# Altium schematic sheet RK3568-SARADC-GPIO.SchDoc
size 420 x 297 mm; SheetNumber: 9; SheetTotal: 25
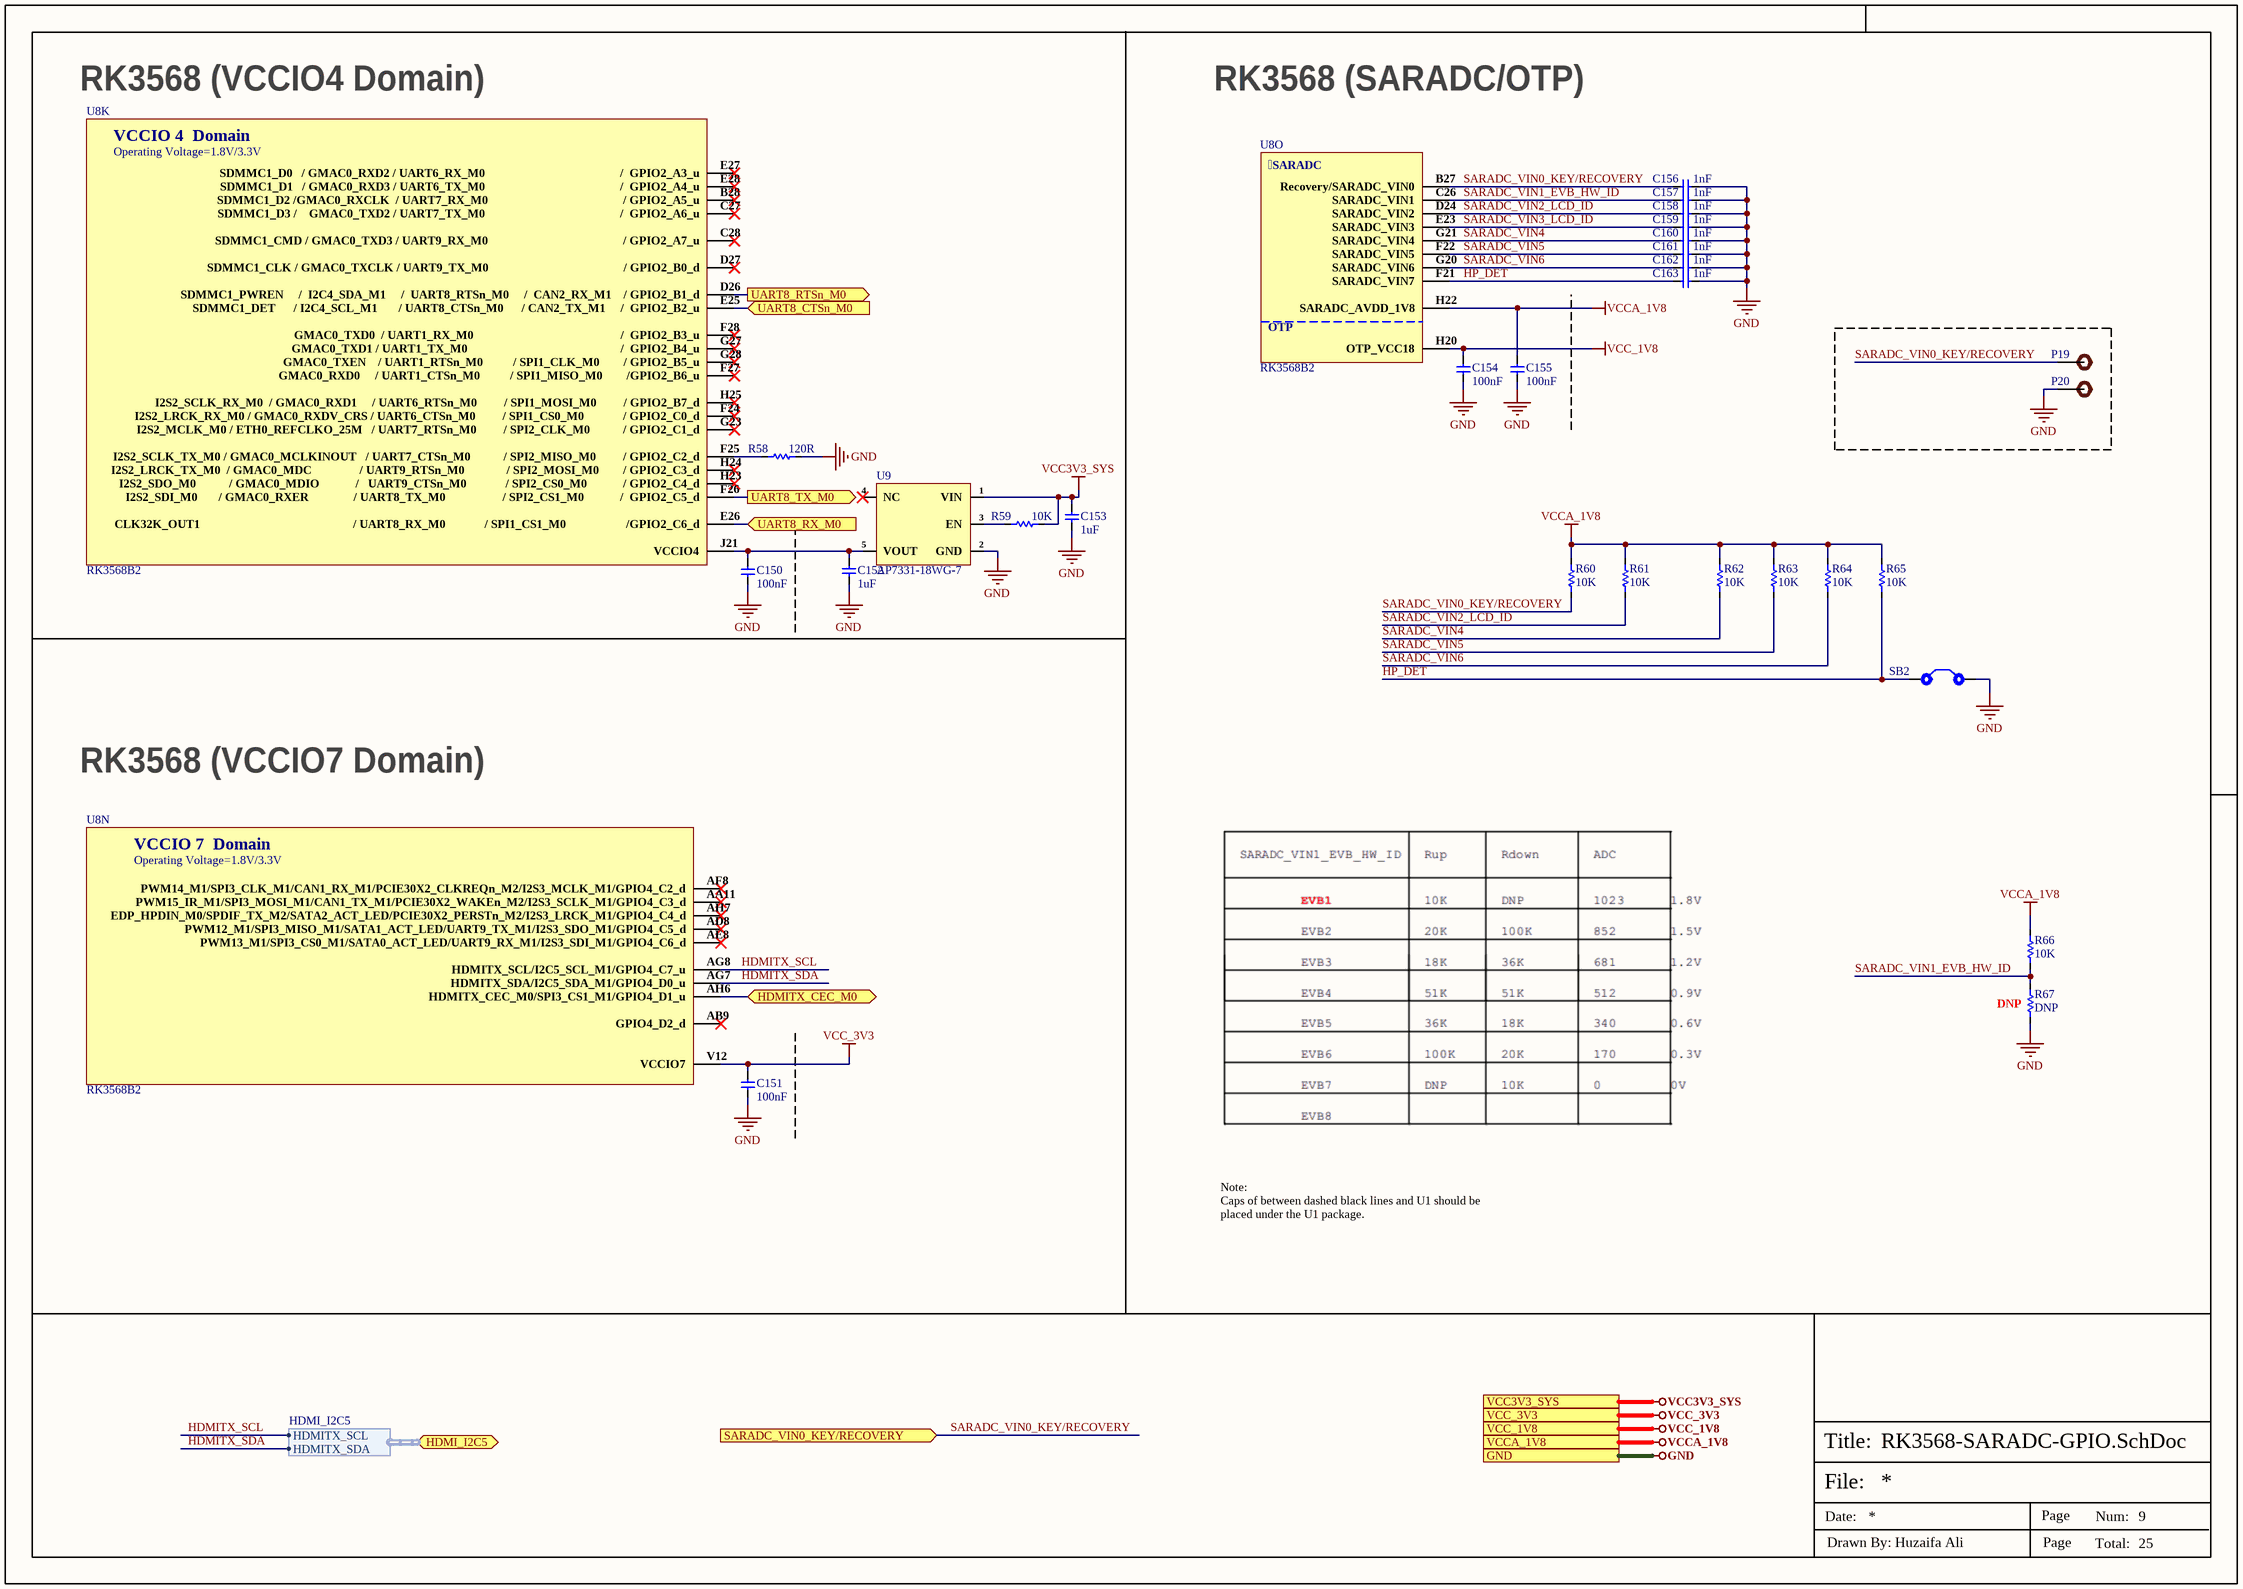
[diagram p0: RK3568-SARADC-GPIO.SchDoc]

## Parts
C150  100nF  [CAP-0201]
C151  100nF  [CAP-0201]
C152  1uF  [Cap-0402]
C153  1uF  [Cap-0402]
C154  100nF  [CAP-0201]
C155  100nF  [CAP-0201]
C156  1nF  [CAP-0201]
C157  1nF  [CAP-0201]
C158  1nF  [CAP-0201]
C159  1nF  [CAP-0201]
C160  1nF  [CAP-0201]
C161  1nF  [CAP-0201]
C162  1nF  [CAP-0201]
C163  1nF  [CAP-0201]
P19  TEST POINT 0.5mm Dia  [Test-point - 0.5mm]  (value not drawn)  (no BOM)
P20  TEST POINT 0.5mm Dia  [Test-point - 0.5mm]  (value not drawn)  (no BOM)
R58  120R  [Res-0201]
R59  10K  [Res-0402]
R60  10K  [Res-0201]
R61  10K  [Res-0201]
R62  10K  [Res-0201]
R63  10K  [Res-0201]
R64  10K  [Res-0201]
R65  10K  [Res-0201]
R66  10K  [Res-0201]
R67  DNP  [Res-0201]
SB2  Solder Bridge 0402  [Solder Bridge 0402]  (value not drawn)  (no BOM)
U8  RK3568B2  [FCCSP-636L]  (parts K,N,O of 23)
U9  AP7331-18WG-7  [SOT-23-5]

## Ports
GND (see CAN-Bus-SPI-Flash-Sheet[4D], Connector-Sheet[5D], DRAM-LPDDR4x-Sheet[4D], eMMC-Sheet[4D], LED-Debug-Sheet[4D], Power-DC-IN-Sheet[4D], Power-Others-Sheet[4D], Power-PMIC-Sheet[4D], RK3568-Audio-Interface[4D], RK3568-Flash-SD-Controller[4D], RK3568-OSC-PMUIO-Sheet[5D], RK3568-Power-Sheet[4D], RK3568-USB-PCIe-Sheet[5D], RK3568-VI-Interface-Sheet[4D], RK3568-VO-Interface-1[4D], RK3568-VO-Interface-2[4D], Sensors-Sheet-1[4D], Sensors-Sheet-2[5D], Type-C-Sheet[4D], USB-Ports[4D], VO-HDMI2.0-TX-Sheet[4D], VO-LCM-MIPI-DSI-TX0[4D], WIFI-BT-SDIO-Sheet[4D]), HDMI_I2C5 (bidir, harness HDMI_I2C5, see VO-HDMI2.0-TX-Sheet[4D]), HDMITX_CEC_M0 (bidir, see VO-HDMI2.0-TX-Sheet[1C]), SARADC_VIN0_KEY/RECOVERY (in, see LED-Debug-Sheet[4A]), UART8_CTSn_M0 (in, see WIFI-BT-SDIO-Sheet[4B]), UART8_RTSn_M0 (out, see WIFI-BT-SDIO-Sheet[4B]), UART8_RX_M0 (in, see WIFI-BT-SDIO-Sheet[4B]), UART8_TX_M0 (out, see WIFI-BT-SDIO-Sheet[4B]), VCC3V3_SYS (see DRAM-LPDDR4x-Sheet[4D], Power-DC-IN-Sheet[4D], Power-PMIC-Sheet[3D]), VCC_1V8 (see Power-Others-Sheet[4D], Power-PMIC-Sheet[4D], RK3568-VI-Interface-Sheet[4D], WIFI-BT-SDIO-Sheet[4D]), VCC_3V3 (see eMMC-Sheet[4D], Power-PMIC-Sheet[4D], RK3568-USB-PCIe-Sheet[5D], RK3568-VO-Interface-2[4D], VO-HDMI2.0-TX-Sheet[4D], WIFI-BT-SDIO-Sheet[4D]), VCCA_1V8 (see LED-Debug-Sheet[4D], Power-PMIC-Sheet[4D], RK3568-OSC-PMUIO-Sheet[5D], RK3568-USB-PCIe-Sheet[5D])

## Harnesses
HDMI_I2C5: HDMITX_SCL, HDMITX_SDA

## Nets
GND: C150.1 C151.1 C152.2 C153.2 C154.1 C155.1 C156.2 C157.2 C158.2 C159.2 C160.2 C161.2 C162.2 C163.2 P20.1 R58.2 R67.2 SB2.2 U9.2(GND) ; port GND
VCC3V3_SYS: C153.1 R59.1 U9.1(VIN) ; port VCC3V3_SYS
VCC_1V8: C154.2 U8.H20(OTP_VCC18) ; port VCC_1V8
VCC_3V3: C151.2 U8.V12(VCCIO7) ; port VCC_3V3
VCCA_1V8: C155.2 R60.1 R61.1 R62.1 R63.1 R64.1 R65.1 R66.1 U8.H22(SARADC_AVDD_1V8) ; port VCCA_1V8
HDMITX_CEC_M0: U8.AH6(HDMITX_CEC_M0/SPI3_CS1_M1/GPIO4_D1_u) ; port HDMITX_CEC_M0
HDMITX_SCL: U8.AG8(HDMITX_SCL/I2C5_SCL_M1/GPIO4_C7_u) ; port HDMI_I2C5.HDMITX_SCL
HDMITX_SDA: U8.AG7(HDMITX_SDA/I2C5_SDA_M1/GPIO4_D0_u) ; port HDMI_I2C5.HDMITX_SDA
HP_DET: C163.1 R65.2 SB2.1 U8.F21(SARADC_VIN7)
SARADC_VIN0_KEY/RECOVERY: C156.1 P19.1 R60.2 U8.B27(Recovery/SARADC_VIN0) ; port SARADC_VIN0_KEY/RECOVERY
SARADC_VIN1_EVB_HW_ID: C157.1 R66.2 R67.1 U8.C26(SARADC_VIN1)
SARADC_VIN2_LCD_ID: C158.1 R61.2 U8.D24(SARADC_VIN2)
SARADC_VIN3_LCD_ID: C159.1 U8.E23(SARADC_VIN3)
SARADC_VIN4: C160.1 R62.2 U8.G21(SARADC_VIN4)
SARADC_VIN5: C161.1 R63.2 U8.F22(SARADC_VIN5)
SARADC_VIN6: C162.1 R64.2 U8.G20(SARADC_VIN6)
UART8_CTSn_M0: U8.E25(SDMMC1_DET______/_I2C4_SCL_M1_______/_UART8_CTSn_M0______/_CAN2_TX_M1_____/__GPIO2_B2_u) ; port UART8_CTSn_M0
UART8_RTSn_M0: U8.D26(SDMMC1_PWREN_____/__I2C4_SDA_M1_____/__UART8_RTSn_M0_____/__CAN2_RX_M1____/_GPIO2_B1_d) ; port UART8_RTSn_M0
UART8_RX_M0: U8.E26(CLK32K_OUT1___________________________________________________/_UART8_RX_M0_____________/_SPI1_CS1_M0____________________/GPIO2_C6_d) ; port UART8_RX_M0
UART8_TX_M0: U8.F26(I2S2_SDI_M0_______/_GMAC0_RXER_______________/_UART8_TX_M0___________________/_SPI2_CS1_M0____________/__GPIO2_C5_d) ; port UART8_TX_M0
NetC150_2: C150.2 C152.1 U8.J21(VCCIO4) U9.5(VOUT)
NetR58_1: R58.1 U8.F25(I2S2_SCLK_TX_M0_/_GMAC0_MCLKINOUT___/_UART7_CTSn_M0___________/_SPI2_MISO_M0_________/_GPIO2_C2_d)
NetR59_2: R59.2 U9.3(EN)

Not connected (* = marked no-connect by the designer): U8 AA11(PWM15_IR_M1/SPI3_MOSI_M1/CAN1_TX_M1/PCIE30X2_WAKEn_M2/I2S3_SCLK_M1/GPIO4_C3_d)* AB9(GPIO4_D2_d)* AD8(PWM12_M1/SPI3_MISO_M1/SATA1_ACT_LED/UART9_TX_M1/I2S3_SDO_M1/GPIO4_C5_d)* AE8(PWM13_M1/SPI3_CS0_M1/SATA0_ACT_LED/UART9_RX_M1/I2S3_SDI_M1/GPIO4_C6_d)* AF8(PWM14_M1/SPI3_CLK_M1/CAN1_RX_M1/PCIE30X2_CLKREQn_M2/I2S3_MCLK_M1/GPIO4_C2_d)* AH7(EDP_HPDIN_M0/SPDIF_TX_M2/SATA2_ACT_LED/PCIE30X2_PERSTn_M2/I2S3_LRCK_M1/GPIO4_C4_d)* B28(SDMMC1_D2_/GMAC0_RXCLK__/_UART7_RX_M0_____________________________________________/_GPIO2_A5_u)* C27(SDMMC1_D3_/____GMAC0_TXD2_/_UART7_TX_M0_____________________________________________/__GPIO2_A6_u)* C28(SDMMC1_CMD_/_GMAC0_TXD3_/_UART9_RX_M0_____________________________________________/_GPIO2_A7_u)* D27(SDMMC1_CLK_/_GMAC0_TXCLK_/_UART9_TX_M0_____________________________________________/_GPIO2_B0_d)* E27(SDMMC1_D0___/_GMAC0_RXD2_/_UART6_RX_M0_____________________________________________/__GPIO2_A3_u)* E28(SDMMC1_D1___/_GMAC0_RXD3_/_UART6_TX_M0_____________________________________________/__GPIO2_A4_u)* F24(I2S2_LRCK_RX_M0_/_GMAC0_RXDV_CRS_/_UART6_CTSn_M0_________/_SPI1_CS0_M0_____________/_GPIO2_C0_d)* F27(GMAC0_RXD0_____/_UART1_CTSn_M0__________/_SPI1_MISO_M0________/GPIO2_B6_u)* F28(GMAC0_TXD0__/_UART1_RX_M0_________________________________________________/__GPIO2_B3_u)* G23(I2S2_MCLK_M0_/_ETH0_REFCLKO_25M___/_UART7_RTSn_M0_________/_SPI2_CLK_M0___________/_GPIO2_C1_d)* G27(GMAC0_TXD1_/_UART1_TX_M0___________________________________________________/__GPIO2_B4_u)* G28(GMAC0_TXEN____/_UART1_RTSn_M0__________/_SPI1_CLK_M0________/_GPIO2_B5_u)* H23(I2S2_SDO_M0___________/_GMAC0_MDIO____________/___UART9_CTSn_M0_____________/_SPI2_CS0_M0____________/_GPIO2_C4_d)* H24(I2S2_LRCK_TX_M0__/_GMAC0_MDC________________/_UART9_RTSn_M0______________/_SPI2_MOSI_M0________/_GPIO2_C3_d)* H25(I2S2_SCLK_RX_M0__/_GMAC0_RXD1_____/_UART6_RTSn_M0_________/_SPI1_MOSI_M0_________/_GPIO2_B7_d)*; U9 4(NC)*

## Notes on the sheet
- RK3568 (VCCIO4 Domain)
- RK3568 (SARADC/OTP)
- RK3568 (VCCIO7 Domain)
- (near R67) DNP
- Note:
  Caps of between dashed black lines and U1 should be placed under the U1 package.
- File:
- Title:
- Date:
- Page
- Num:
- Total:
- Drawn By: Huzaifa Ali
- (in symbol RK3568B2, part K) VCCIO 4  Domain; Operating Voltage=1.8V/3.3V
- (in symbol RK3568B2, part N) VCCIO 7  Domain; Operating Voltage=1.8V/3.3V
- (in symbol RK3568B2, part O) SARADC; OTP

## Library data of the parts
C150 C151 C154 C155 = CC0201KRX5R6BB104: CAP CER 0.1UF 10V X5R 0201; Manufacturer: Yageo; Tolerance: 10%; Supplier 1: Mouser; Manufacturer Part Number: CC0201KRX5R6BB104; RoHS: Yes; Category: Ceramic Capacitors; Stock 1: 824403; Pricing 1: 1=0.10000, 10=0.02400, 50=0.02400, 100=0.01900, 1000=0.01100, 10000=0.00900 (USD); Mount: Surface Mount; Case/Package: 0201; Case Code (Imperial): 0201; Case Code (Metric): 0603; Weight: 6E-06oz; Min Operating Temperature: -55°C; Max Operating Temperature: 85°C; Capacitance: 100nF; Dielectric: X5R; Voltage Rating (DC): 10V; Packaging: Tape and Reel; Termination: SMD/SMT; Resistor Type: Ceramic; Voltage Rating: 10V; Series: CC; Construction: Flat; Length: 0.6mm; Width: 0.012inch; Height: 0.3mm; Thickness: 0.013inch; Depth: 0.3mm; Radiation Hardening: No; Lead Free: Lead Free; Halogen Free: Halogen Free; RoHS Compliant: Yes; ComponentLink1URL: https://datasheet.ciiva.com/11587/upy-gphc-x5r-4v-to-50v-12-11587190.pdf?src-supplier=Avnet; ComponentLink1Description: https://datasheet.ciiva.com/11587/upy-gphc-x5r-4v-to-50v-12-11587190.pdf?src-supplier=Avnet; Supplier Part Number 1: 603-CC201KRX5R6BB104; LCSC Part Number: C190183
C152 C153 = CC0402KRX5R6BB105: CAP CER 1UF 10V X5R 0402; Manufacturer: Yageo; Tolerance: 10%; Dissipation Factor: 15%; Item Type: Capacitor; Supplier 1: Mouser; Manufacturer Part Number: CC0402KRX5R6BB105; RoHS: Yes; Category: Ceramic Capacitors; Stock 1: 6711367; Pricing 1: 1=0.11000, 10=0.05500, 50=0.05500, 100=0.03300, 500=0.02700, 1000=0.02200, 2500=0.02100, 10000=0.01800 (USD); Mount: Surface Mount; Case/Package: 0402; Number of Pins: 2; Case Code (Metric): 1005; Case Code (Imperial): 0402; Min Operating Temperature: -55°C; Max Operating Temperature: 85°C; Capacitance: 1uF; Dielectric: X5R; Package Quantity: 1; Voltage Rating: 10V; Packaging: Tape and Reel; Voltage Rating (DC): 10V; Termination: SMD/SMT; Resistor Type: Ceramic; Series: CC; Construction: Flat; Length: 1mm; Width: 0.02inch; Height: 0.5mm; Thickness: 0.022inch; Depth: 0.5mm; Radiation Hardening: No; REACH SVHC: No SVHC; Lead Free: Lead Free; Halogen Free: Halogen Free; RoHS Compliant: Yes; ComponentLink1URL: https://datasheet.ciiva.com/176/upy-gphc-x5r-4v-to-50v-12-176704.pdf?src-supplier=Digi-Key; ComponentLink1Description: https://datasheet.ciiva.com/176/upy-gphc-x5r-4v-to-50v-12-176704.pdf?src-supplier=Digi-Key; ComponentLink2URL: https://datasheet.ciiva.com/176/mlccorderingcode-176705.pdf?src-supplier=Digi-Key; ComponentLink2Description: https://datasheet.ciiva.com/176/mlccorderingcode-176705.pdf?src-supplier=Digi-Key; ComponentLink3URL: https://datasheet.ciiva.com/176/mlccorderingcode-176706.pdf?src-supplier=Digi-Key; ComponentLink3Description: https://datasheet.ciiva.com/176/mlccorderingcode-176706.pdf?src-supplier=Digi-Key; Supplier Part Number 1: 603-CC402KRX5R6BB105; LCSC Part Number: C106254
C156-C163 = 0201B102K500NT: 50V 1nF X7R ±10% 0201 Multilayer Ceramic Capacitors MLCC - SMD/SMT ROHS; Manufacturer: FH; Manufacturer Part Number: 0201B102K500NT; ComponentLink1URL: https://www.lcsc.com/product-detail/Multilayer-Ceramic-Capacitors-MLCC-SMD-SMT_FH-Guangdong-Fenghua-Advanced-Tech-0201B102K500NT_C66942.html; ComponentLink1Description: LCSC; LCSC Part Number: C66942; Item Type: Capacitor; Value: 1nF
P19 P20 = TEST POINT 0.5mm Dia: Test Point ON; Item Type: Test Point; Manufacturer Part Number: TEST POINT 0.5mm Dia
R58 = RC0201FR-07120RL: RES 120 OHM 1% 1/20W 0201; Manufacturer: Yageo; Item Type: Resistor; Supplier: Digikey; Supplier Part Number: 311-120MCT-ND; Manufacturer Part Number: RC0201FR-07120RL; RoHS: Yes; Category: Chip SMD Resistors; Stock: 38339; Pricing: 1=0.1, 10=0.027, 50=0.0172, 100=0.0143, 500=0.00988, 1000=0.00854, 5000=0.00629 (USD); Lead Free: 5697LeadFree; ComponentLink1URL: https://datasheet.ciiva.com/2525/pyu-r-int-thick-7-2525064.pdf?src-supplier=Digikey; ComponentLink1Description: https://datasheet.ciiva.com/2525/pyu-r-int-thick-7-2525064.pdf?src-supplier=Digikey; ComponentLink2URL: https://datasheet.ciiva.com/22661/1563626-22661285.pdf?src-supplier=Element14; ComponentLink2Description: https://datasheet.ciiva.com/22661/1563626-22661285.pdf?src-supplier=Element14; ComponentLink3URL: https://datasheet.ciiva.com/2525/pyu-r-int-thick-7-2525062.pdf?src-supplier=Digikey; ComponentLink3Description: https://datasheet.ciiva.com/2525/pyu-r-int-thick-7-2525062.pdf?src-supplier=Digikey; ComponentLink4URL: https://datasheet.ciiva.com/2525/pyu-r-int-thick-7-2525063.pdf?src-supplier=Digikey; ComponentLink4Description: https://datasheet.ciiva.com/2525/pyu-r-int-thick-7-2525063.pdf?src-supplier=Digikey; LCSC Part Number: C295718
R59 = RC0402FR-0710KL: RES 10K OHM 1% 1/16W 0402; Manufacturer: Yageo; Resistance: 10kR; Voltage Rating (DC): 50V; Temperature Coefficient: 100ppm/°C; Power Rating: 62.5mW; Max Power Dissipation: 63mW; Item Type: Resistor; Supplier 1: Mouser; Manufacturer Part Number: RC0402FR-0710KL; RoHS: Yes; Category: Chip SMD Resistors; Stock 1: 18648329; Pricing 1: 1=0.10000, 10=0.01400, 50=0.01400, 100=0.00500, 1000=0.00300, 10000=0.00200 (USD); Case/Package: 0402; Number of Pins: 2; Case Code (Imperial): 0402; Case Code (Metric): 1005; Min Operating Temperature: -55°C; Max Operating Temperature: 155°C; Resistor Type: Thick Film; Tolerance: 1%; Packaging: Tape and Reel; Voltage Rating: 50V; Termination: SMD/SMT; Working Voltage: 50V; Number of Terminations: 2; Features: Moisture Resistant; Series: RC; Resistance Tolerance: 1%; Construction: Rectangular; Length: 1mm; Width: 0.5mm; Height: 0.32mm; Depth: 0.5mm; Lead Pitch: 0.2mm; REACH SVHC: No SVHC; Lead Free: Lead Free; RoHS Compliant: Yes; Military Standard: Not; ComponentLink1URL: https://datasheet.ciiva.com/7660/38568-7660787.pdf?src-supplier=Element14; ComponentLink1Description: https://datasheet.ciiva.com/7660/38568-7660787.pdf?src-supplier=Element14; ComponentLink2URL: https://datasheet.ciiva.com/7849/1686128-7849814.pdf?src-supplier=Element14; ComponentLink2Description: https://datasheet.ciiva.com/7849/1686128-7849814.pdf?src-supplier=Element14; ComponentLink3URL: https://datasheet.ciiva.com/7983/1018594-7983486.pdf?src-supplier=Element14; ComponentLink3Description: https://datasheet.ciiva.com/7983/1018594-7983486.pdf?src-supplier=Element14; ComponentLink4URL: https://datasheet.ciiva.com/22747/1018594-22747512.pdf?src-supplier=Element14; ComponentLink4Description: https://datasheet.ciiva.com/22747/1018594-22747512.pdf?src-supplier=Element14; ComponentLink5URL: https://datasheet.ciiva.com/12667/pyu-rc0402-51-rohs-l-6-r-12667067.pdf?src-supplier=Mouser; ComponentLink5Description: https://datasheet.ciiva.com/12667/pyu-rc0402-51-rohs-l-6-r-12667067.pdf?src-supplier=Mouser; ComponentLink6URL: https://datasheet.ciiva.com/7849/1784430-7849813.pdf?src-supplier=Element14; ComponentLink6Description: https://datasheet.ciiva.com/7849/1784430-7849813.pdf?src-supplier=Element14; ComponentLink7URL: https://datasheet.ciiva.com/7849/1784430-7849815.pdf?src-supplier=Element14; ComponentLink7Description: https://datasheet.ciiva.com/7849/1784430-7849815.pdf?src-supplier=Element14; Supplier Part Number 1: 603-RC0402FR-0710KL; LCSC Part Number: C60490
R60-R67 = RC0201FR-0710KL: RES SMD 10K OHM 1% 1/20W 0201; Manufacturer: Yageo; Item Type: Resistor; Manufacturer Part Number: RC0201FR-0710KL; ComponentLink7URL: https://www.lcsc.com/product-detail/Chip-Resistor-Surface-Mount_YAGEO-RC0201FR-0710KL_C106225.html; ComponentLink7Description: LCSC; LCSC Part Number: C106225; Package: 0201
SB2 = Solder Bridge 0402: Solder Bridge ON; Manufacturer Part Number: Solder Bridge 0402; Item Type: Solder Bridge
U8 = RK3568B2: FCCSP-636L Microcontroller Units (MCUs/MPUs/SOCs) ROHS; Manufacturer: Rockchip; Item Type: IC; Manufacturer Part Number: RK3568B2; Package: FCCSP-636L; LCSC Part Number: C3345225
U9 = AP7331-18WG-7: IC REG LINEAR 1.8V 300MA SOT25; Manufacturer: Diodes; Number of Outputs: 1; Min Input Voltage: 2V; Max Input Voltage: 6V; Max Power Dissipation: 640mW; Polarity: Positive; Quiescent Current: 55uA; Accuracy: 2%; Output Type: Fixed; Dropout Voltage: 550mV; Min Current Limit: 400mA; Reference Voltage: 400mV; Power Dissipation: 640W; Power Supply Rejection Ratio (PSRR): 65dB; Supplier 1: Digi-Key; Manufacturer Part Number: AP7331-18WG-7; RoHS: Yes; Category: Voltage Regulators - Linear; Stock 1: 2879; Pricing 1: 1=0.48000, 10=0.38700, 25=0.35400, 100=0.26360, 250=0.23884, 500=0.19766, 1000=0.14825 (USD); Mount: Surface Mount; Case/Package: SOT-25; Number of Pins: 5; Contact Plating: Tin,Matte; Min Operating Temperature: -40°C; Max Operating Temperature: 85°C; Max Output Current: 300mA; Output Voltage: 1.8V; Packaging: Tape and Reel; Output Current: 300mA; Package Quantity: 3000; Number of Regulators: 1; Series: AP7331; Length: 3.1mm; Width: 1.7mm; Height: 1.3mm; Radiation Hardening: No; Lead Free: Lead Free; REACH SVHC: No SVHC; RoHS Compliant: Yes; ComponentLink1URL: https://datasheet.ciiva.com/4887/ap7331-84206-4887904.pdf?src-supplier=Mouser; ComponentLink1Description: https://datasheet.ciiva.com/4887/ap7331-84206-4887904.pdf?src-supplier=Mouser; ComponentLink2URL: https://datasheet.ciiva.com/26856/getdatasheetpartid-661842-26856377.pdf?src-supplier=Verical; ComponentLink2Description: https://datasheet.ciiva.com/26856/getdatasheetpartid-661842-26856377.pdf?src-supplier=Verical; ComponentLink3URL: https://datasheet.ciiva.com/26908/ap7331-18wg-7-26908418.pdf?src-supplier=IIIC; ComponentLink3Description: https://datasheet.ciiva.com/26908/ap7331-18wg-7-26908418.pdf?src-supplier=IIIC; Supplier Part Number 1: AP7331-18WG-7DICT-ND; LCSC Part Number: C155293; Item Type: IC